# Altium schematic sheet IDC_Tester_v1_LED_2.SchDoc
size 420 x 297 mm; SheetNumber: 5; SheetTotal: 10
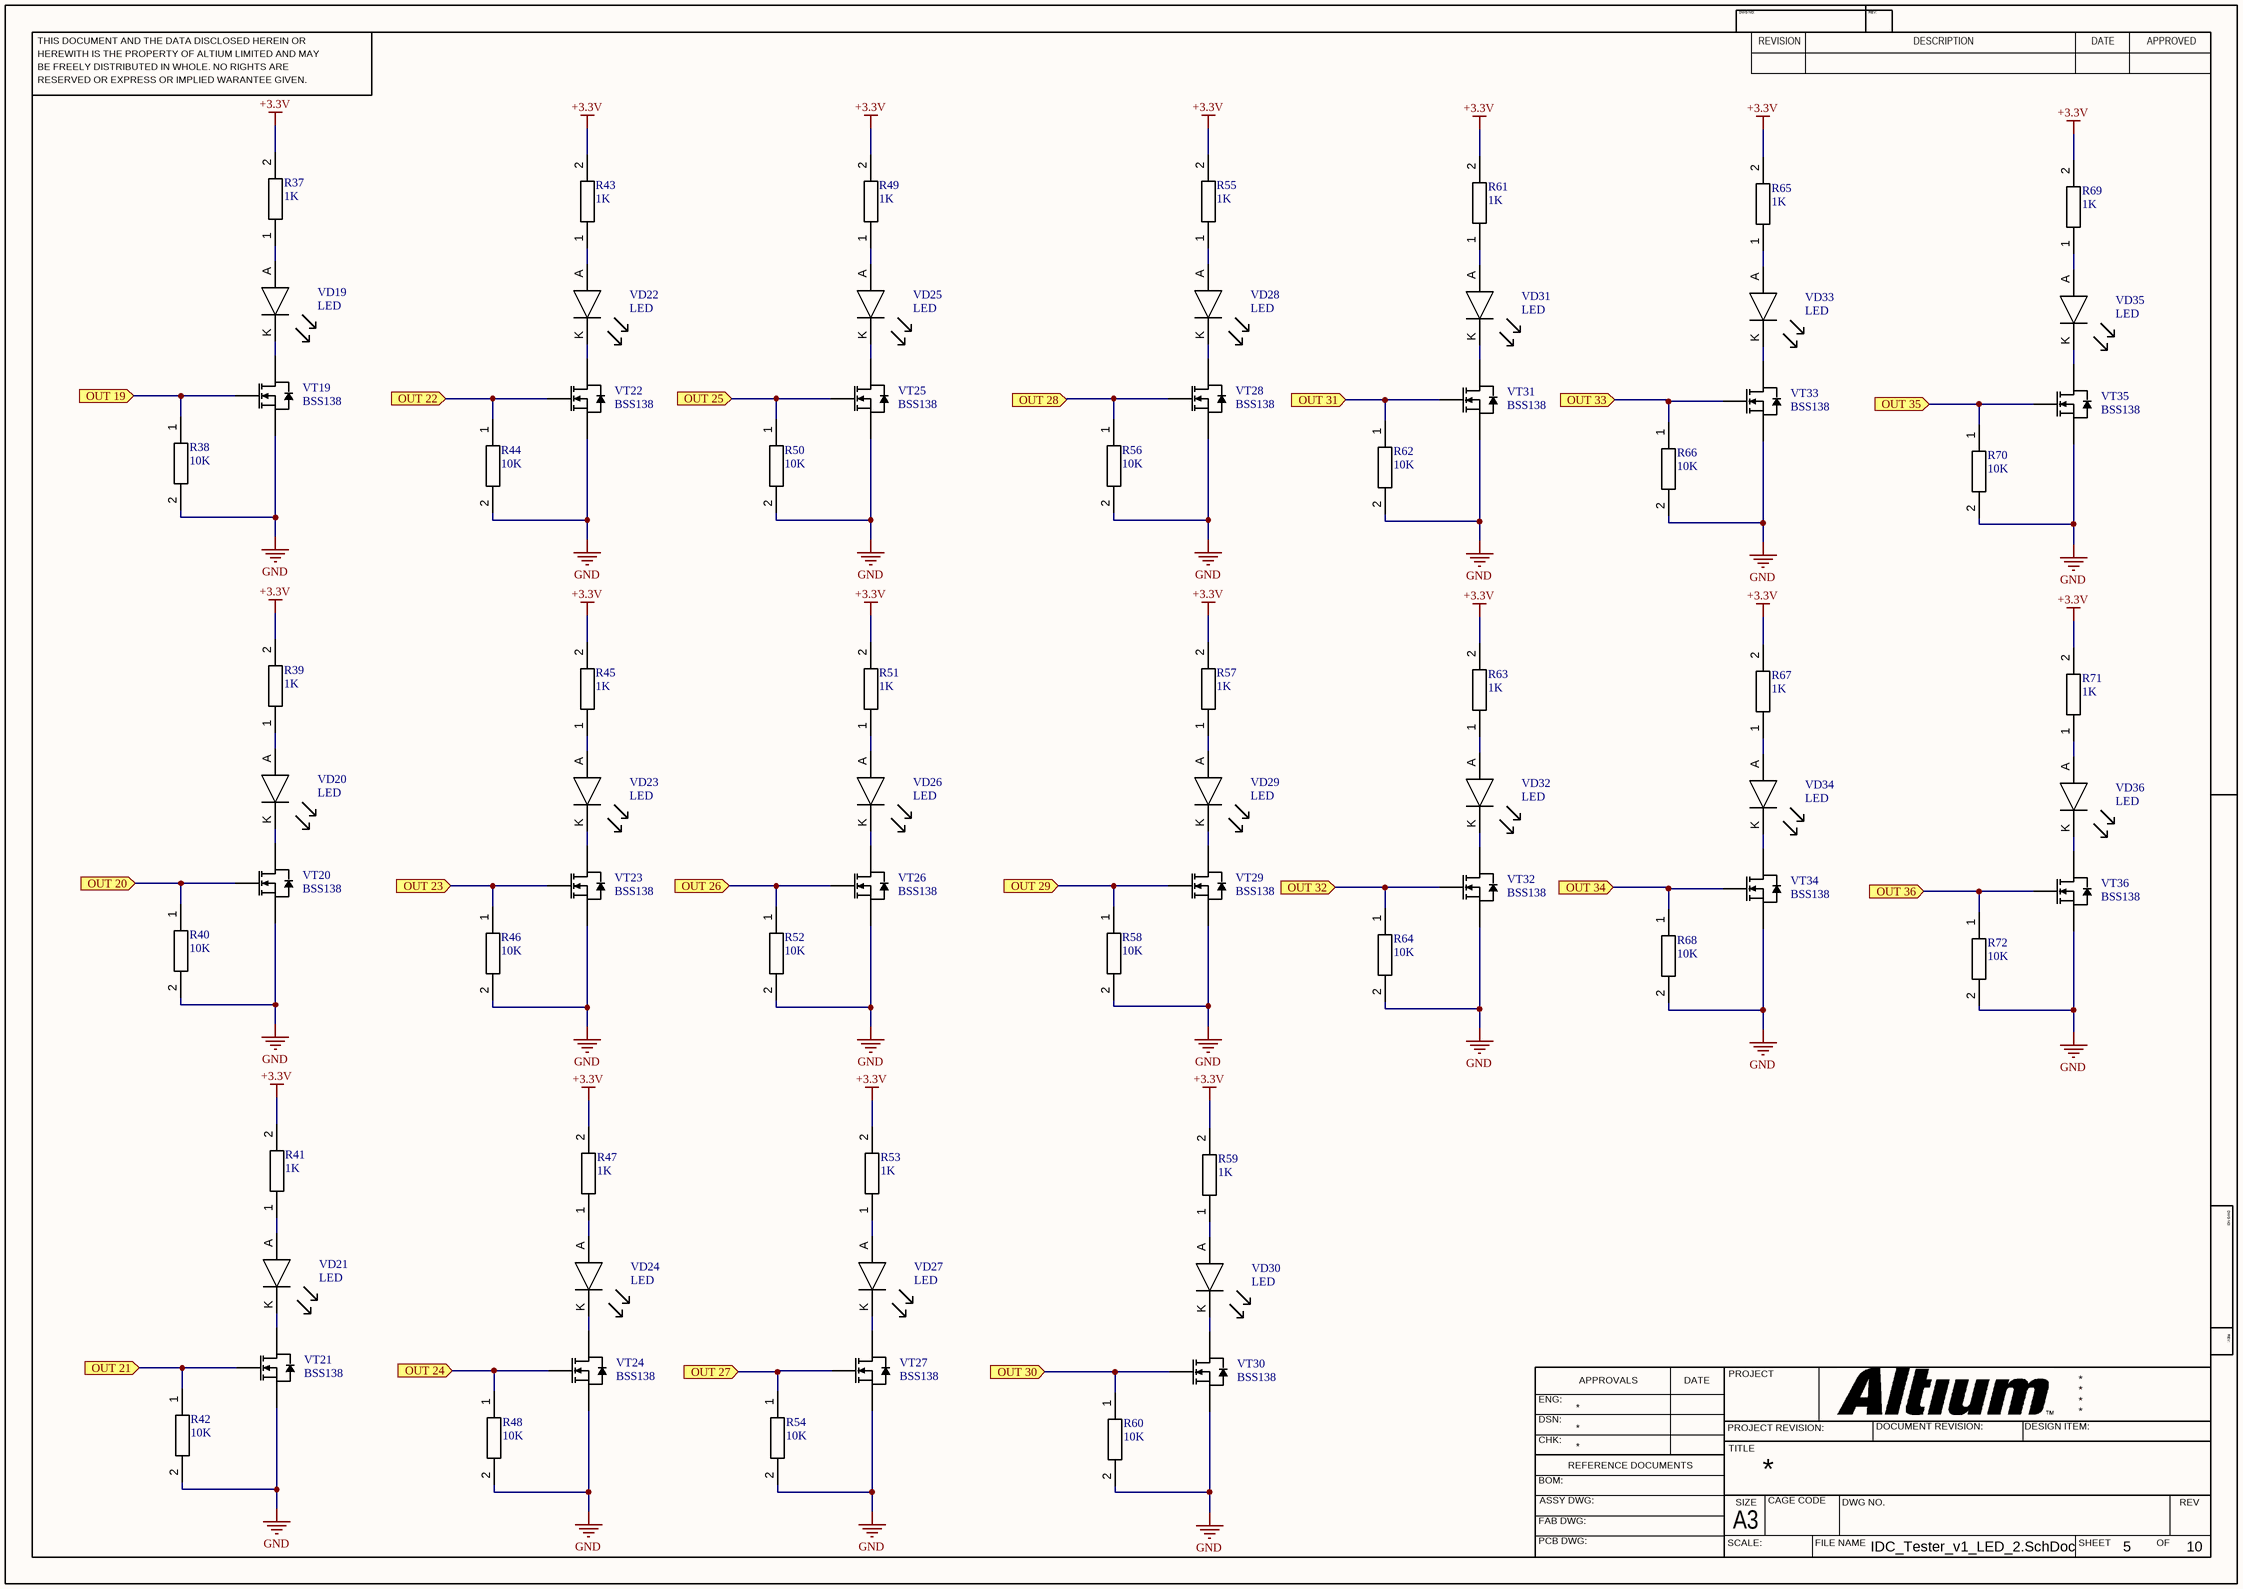
[diagram p0: IDC_Tester_v1_LED_2.SchDoc]

## Parts
R37  1K  [Resistor 0603]
R38  10K  [Resistor 0603]
R39  1K  [Resistor 0603]
R40  10K  [Resistor 0603]
R41  1K  [Resistor 0603]
R42  10K  [Resistor 0603]
R43  1K  [Resistor 0603]
R44  10K  [Resistor 0603]
R45  1K  [Resistor 0603]
R46  10K  [Resistor 0603]
R47  1K  [Resistor 0603]
R48  10K  [Resistor 0603]
R49  1K  [Resistor 0603]
R50  10K  [Resistor 0603]
R51  1K  [Resistor 0603]
R52  10K  [Resistor 0603]
R53  1K  [Resistor 0603]
R54  10K  [Resistor 0603]
R55  1K  [Resistor 0603]
R56  10K  [Resistor 0603]
R57  1K  [Resistor 0603]
R58  10K  [Resistor 0603]
R59  1K  [Resistor 0603]
R60  10K  [Resistor 0603]
R61  1K  [Resistor 0603]
R62  10K  [Resistor 0603]
R63  1K  [Resistor 0603]
R64  10K  [Resistor 0603]
R65  1K  [Resistor 0603]
R66  10K  [Resistor 0603]
R67  1K  [Resistor 0603]
R68  10K  [Resistor 0603]
R69  1K  [Resistor 0603]
R70  10K  [Resistor 0603]
R71  1K  [Resistor 0603]
R72  10K  [Resistor 0603]
VD19  LED  [Led 0603 - duplicate]
VD20  LED  [Led 0603 - duplicate]
VD21  LED  [Led 0603 - duplicate]
VD22  LED  [Led 0603 - duplicate]
VD23  LED  [Led 0603 - duplicate]
VD24  LED  [Led 0603 - duplicate]
VD25  LED  [Led 0603 - duplicate]
VD26  LED  [Led 0603 - duplicate]
VD27  LED  [Led 0603 - duplicate]
VD28  LED  [Led 0603 - duplicate]
VD29  LED  [Led 0603 - duplicate]
VD30  LED  [Led 0603 - duplicate]
VD31  LED  [Led 0603 - duplicate]
VD32  LED  [Led 0603 - duplicate]
VD33  LED  [Led 0603 - duplicate]
VD34  LED  [Led 0603 - duplicate]
VD35  LED  [Led 0603 - duplicate]
VD36  LED  [Led 0603 - duplicate]
VT19  BSS138  [SOT-23-3]
VT20  BSS138  [SOT-23-3]
VT21  BSS138  [SOT-23-3]
VT22  BSS138  [SOT-23-3]
VT23  BSS138  [SOT-23-3]
VT24  BSS138  [SOT-23-3]
VT25  BSS138  [SOT-23-3]
VT26  BSS138  [SOT-23-3]
VT27  BSS138  [SOT-23-3]
VT28  BSS138  [SOT-23-3]
VT29  BSS138  [SOT-23-3]
VT30  BSS138  [SOT-23-3]
VT31  BSS138  [SOT-23-3]
VT32  BSS138  [SOT-23-3]
VT33  BSS138  [SOT-23-3]
VT34  BSS138  [SOT-23-3]
VT35  BSS138  [SOT-23-3]
VT36  BSS138  [SOT-23-3]

## Ports
OUT 19 (in), OUT 20 (in), OUT 21 (in), OUT 22 (in), OUT 23 (in), OUT 24 (in), OUT 25 (in), OUT 26 (in), OUT 27 (in), OUT 28 (in), OUT 29 (in), OUT 30 (in), OUT 31 (in), OUT 32 (in), OUT 33 (in), OUT 34 (in), OUT 35 (in), OUT 36 (in)

## Nets
+3.3V: R37.2 R39.2 R41.2 R43.2 R45.2 R47.2 R49.2 R51.2 R53.2 R55.2 R57.2 R59.2 R61.2 R63.2 R65.2 R67.2 R69.2 R71.2
GND: R38.2 R40.2 R42.2 R44.2 R46.2 R48.2 R50.2 R52.2 R54.2 R56.2 R58.2 R60.2 R62.2 R64.2 R66.2 R68.2 R70.2 R72.2 VT19.2(S) VT20.2(S) VT21.2(S) VT22.2(S) VT23.2(S) VT24.2(S) VT25.2(S) VT26.2(S) VT27.2(S) VT28.2(S) VT29.2(S) VT30.2(S) VT31.2(S) VT32.2(S) VT33.2(S) VT34.2(S) VT35.2(S) VT36.2(S)
OUT 19: R38.1 VT19.1(G) ; port OUT 19
OUT 20: R40.1 VT20.1(G) ; port OUT 20
OUT 21: R42.1 VT21.1(G) ; port OUT 21
OUT 22: R44.1 VT22.1(G) ; port OUT 22
OUT 23: R46.1 VT23.1(G) ; port OUT 23
OUT 24: R48.1 VT24.1(G) ; port OUT 24
OUT 25: R50.1 VT25.1(G) ; port OUT 25
OUT 26: R52.1 VT26.1(G) ; port OUT 26
OUT 27: R54.1 VT27.1(G) ; port OUT 27
OUT 28: R56.1 VT28.1(G) ; port OUT 28
OUT 29: R58.1 VT29.1(G) ; port OUT 29
OUT 30: R60.1 VT30.1(G) ; port OUT 30
OUT 31: R62.1 VT31.1(G) ; port OUT 31
OUT 32: R64.1 VT32.1(G) ; port OUT 32
OUT 33: R66.1 VT33.1(G) ; port OUT 33
OUT 34: R68.1 VT34.1(G) ; port OUT 34
OUT 35: R70.1 VT35.1(G) ; port OUT 35
OUT 36: R72.1 VT36.1(G) ; port OUT 36
NetR37_1: R37.1 VD19.A
NetR39_1: R39.1 VD20.A
NetR41_1: R41.1 VD21.A
NetR43_1: R43.1 VD22.A
NetR45_1: R45.1 VD23.A
NetR47_1: R47.1 VD24.A
NetR49_1: R49.1 VD25.A
NetR51_1: R51.1 VD26.A
NetR53_1: R53.1 VD27.A
NetR55_1: R55.1 VD28.A
NetR57_1: R57.1 VD29.A
NetR59_1: R59.1 VD30.A
NetR61_1: R61.1 VD31.A
NetR63_1: R63.1 VD32.A
NetR65_1: R65.1 VD33.A
NetR67_1: R67.1 VD34.A
NetR69_1: R69.1 VD35.A
NetR71_1: R71.1 VD36.A
NetVD19_K: VD19.K VT19.3(D)
NetVD20_K: VD20.K VT20.3(D)
NetVD21_K: VD21.K VT21.3(D)
NetVD22_K: VD22.K VT22.3(D)
NetVD23_K: VD23.K VT23.3(D)
NetVD24_K: VD24.K VT24.3(D)
NetVD25_K: VD25.K VT25.3(D)
NetVD26_K: VD26.K VT26.3(D)
NetVD27_K: VD27.K VT27.3(D)
NetVD28_K: VD28.K VT28.3(D)
NetVD29_K: VD29.K VT29.3(D)
NetVD30_K: VD30.K VT30.3(D)
NetVD31_K: VD31.K VT31.3(D)
NetVD32_K: VD32.K VT32.3(D)
NetVD33_K: VD33.K VT33.3(D)
NetVD34_K: VD34.K VT34.3(D)
NetVD35_K: VD35.K VT35.3(D)
NetVD36_K: VD36.K VT36.3(D)

## Notes on the sheet
- THIS DOCUMENT AND THE DATA DISCLOSED HEREIN OR
- HEREWITH IS THE PROPERTY OF ALTIUM LIMITED AND MAY
- DWG NO:
- REVISION
- REV:
- DESCRIPTION
- DATE
- APPROVED
- BE FREELY DISTRIBUTED IN WHOLE. NO RIGHTS ARE
- RESERVED OR EXPRESS OR IMPLIED WARANTEE GIVEN.
- ENG:
- APPROVALS
- PROJECT
- DSN:
- CHK:
- REFERENCE DOCUMENTS
- PROJECT REVISION:
- TITLE
- DOCUMENT REVISION:
- DESIGN ITEM:
- BOM:
- FAB DWG:
- PCB DWG:
- ASSY DWG:
- SCALE:
- A3
- SIZE
- CAGE CODE
- FILE NAME
- DWG NO.
- SHEET
- OF
- REV

## Library data of the parts
R37 R39 R41 R43 R45 R47 R49 R51 R53 R55 R57 R59 R61 R63 R65 R67 R69 R71 = Resistor 1K: Part Number: SMD RES 1K OHM 1%±100ppm/°C 0603 (RMCF0603FT1K00); Added by: viskov2055@gmail.com; Mount_Type: SMD; Solder_Amount: 2; Pkg: 0603; Created at: 13/02/2024; Mount: MOUNT
R38 R40 R42 R44 R46 R48 R50 R52 R54 R56 R58 R60 R62 R64 R66 R68 R70 R72 = Resistor 10K: Part Number: SMD RES 10K OHM 1%±100ppm/°C 0603 (RMCF0603FT10K0); Added by: viskov2055@gmail.com; Mount_Type: SMD; Solder_Amount: 2; Pkg: 0603; Created at: 15/02/2024; Mount: MOUNT
VD19-VD36 = LED: LED Uni-Color Green 515nm 2-Pin SMD T/R; Manufacturer: Kingbright; Manufacturer Part Number: APG1608ZGCK; Lens Style: Flat; Lens Transparency: Clear; Luminous Intensity: 400mcd; Forward Voltage: 3.3V; Test Current: 20mA; Viewing Angle: 130°; Dominant Wavelength: 525nm; Lens Size: 0.8mm; Added by: viskov2055@gmail.com; Solder_Amount: 2; Pkg: 0603; RoHS: Yes; Category: LEDs; Stock 1: 44996; Pricing 1: 1=0,6, 10=0,368, 100=0,2114, 1000=0,16544, 2000=0,15165 (USD); MountType: SMD; Case/Package: 0603; Color: Green; Case Code (Imperial): 0603; Case Code (Metric): 1608; Packaging: Tape and Reel; Length: 1.6mm; Width: 0.8mm; Height: 0.28mm; RoHS Compliant: Yes; ComponentLink1URL: https://datasheet.octopart.com/APG1608ZGCK-Kingbright-datasheet-153682089.pdf?src-supplier=Future+Electronics; ComponentLink1Description: https://datasheet.octopart.com/APG1608ZGCK-Kingbright-datasheet-153682089.pdf?src-supplier=Future+Electronics; ComponentLink2URL: http://www.kingbrightusa.com/images/catalog/SPEC/APG1608ZGCK.pdf?src-supplier=Digikey; ComponentLink2Description: http://www.kingbrightusa.com/images/catalog/SPEC/APG1608ZGCK.pdf?src-supplier=Digikey; ComponentLink3URL: https://datasheet.octopart.com/APG1608ZGCK-Kingbright-datasheet-137408059.pdf?src-supplier=Sager+Electronics; ComponentLink3Description: https://datasheet.octopart.com/APG1608ZGCK-Kingbright-datasheet-137408059.pdf?src-supplier=Sager+Electronics; Supplier Part Number 1: 754-2113-1-ND; Created at: 13/02/2024; Mount: MOUNT; Part Number: APG1608ZGCK; Supplier 1: Digikey
VT19-VT36 = BSS138: N-Channel Logic Level Enhancement Mode Field Effect Transistor; Solder_Amount: 3; Added_by: ma_lubushkin@teslatec.ru; Pkg: SOT-23; Part Number: BSS138; Mount: MOUNT; MountType: SMD; Created_at: 03/12/2019